# Altium project Remote_Sensor_Unit-v1.0.PrjPcb (part 3 of 4)

## Sheet Power_Sheet2.SchDoc
size A4; SheetNumber: 4; SheetTotal: 7
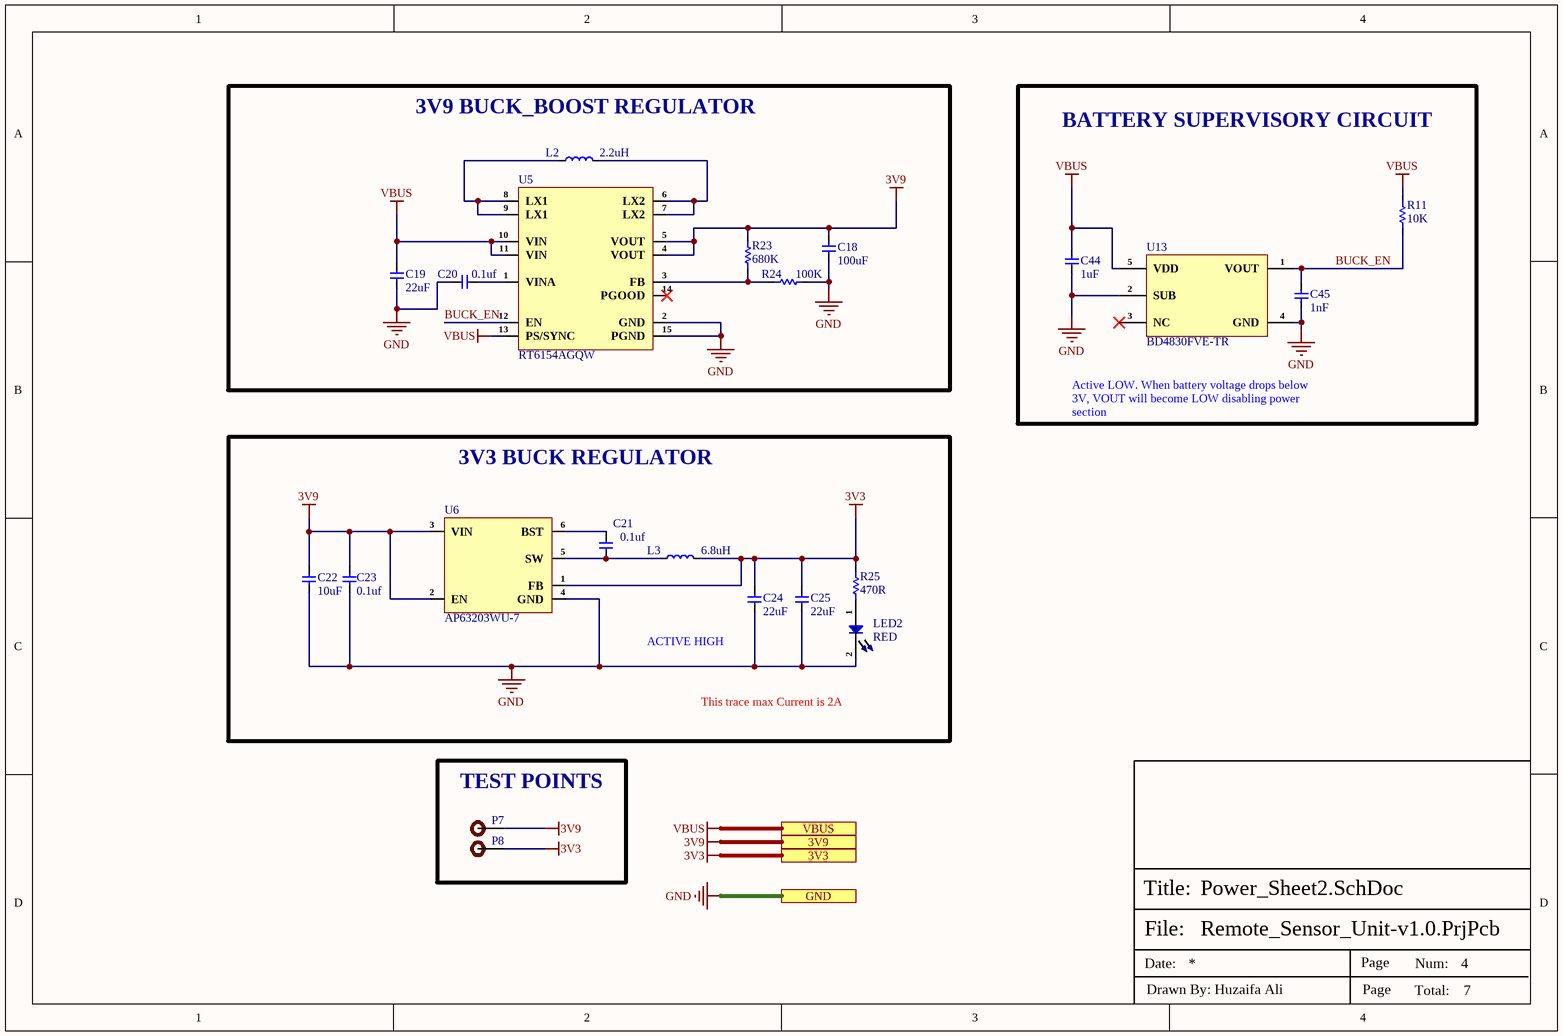
[diagram p3: Power_Sheet2.SchDoc]

### Parts
C18  100uF  [Cap-1210]
C19  22uF  [Cap-0805]
C20  0.1uf  [Cap-0402]
C21  0.1uf  [Cap-0402]
C22  10uF  [Cap-0402]
C23  0.1uf  [Cap-0402]
C24  22uF  [Cap-0805]
C25  22uF  [Cap-0805]
C44  1uF  [Cap-0402]
C45  1nF  [CAP-0201]
L2  2.2uH  [NRS5024T2R2NMGJ]
L3  6.8uH  [LVC505040-6R8M-N_]
LED2  RED  [LED-0603]
P7  TEST POINT  [Test-point]  (value not drawn)
P8  TEST POINT  [Test-point]  (value not drawn)
R11  10K  [Res-0201]
R23  680K  [Res-0603]
R24  100K  [Res-0603]
R25  470R  [Res-0201]
U5  RT6154AGQW  [DFN-14(3x4)]
U6  AP63203WU-7  [TSOT-23-6]
U13  BD4830FVE-TR  [VSOF-5]

### Blocks framed on the sheet
3V9 BUCK_BOOST REGULATOR: C18-C20 L2 R23 R24 U5
BATTERY SUPERVISORY CIRCUIT: C44 C45 R11 U13
3V3 BUCK REGULATOR: C21-C25 L3 LED2 R25 U6
TEST POINTS: P7 P8

### Ports
3V3, 3V9, GND, VBUS

### Nets
3V3: C24.2 C25.2 L3.2 P8.1 R25.2 U6.1(FB) ; port 3V3
3V9: C18.2 C22.2 C23.2 P7.1 R23.2 U5.4(VOUT) U5.5(VOUT) U6.2(EN) U6.3(VIN) ; port 3V9
GND: C18.1 C19.1 C20.2 C22.1 C23.1 C24.1 C25.1 C44.2 C45.1 LED2.2 R24.1 U5.2(GND) U5.15(PGND) U6.4(GND) U13.2(SUB) U13.4(GND) ; port GND
VBUS: C19.2 C44.1 R11.2 U5.10(VIN) U5.11(VIN) U5.13(PS/SYNC) U13.5(VDD) ; port VBUS
BUCK_EN: C45.2 R11.1 U5.12(EN) U13.1(VOUT)
NetC20_1: C20.1 U5.1(VINA)
NetC21_1: C21.1 L3.1 U6.5(SW)
NetC21_2: C21.2 U6.6(BST)
NetL2_1: L2.1 U5.8(LX1) U5.9(LX1)
NetL2_2: L2.2 U5.6(LX2) U5.7(LX2)
NetLED2_1: LED2.1 R25.1
NetR23_1: R23.1 R24.2 U5.3(FB)

Not connected (* = marked no-connect by the designer): U5 14(PGOOD)*; U13 3(NC)*

### Notes on the sheet
- Active LOW. When battery voltage drops below 3V, VOUT will become LOW disabling power section
- (near C24) ACTIVE HIGH
- (near LED2) This trace max Current is 2A
- File:
- Title:
- Date:
- Page
- Num:
- Total:
- Drawn By: Huzaifa Ali

### Library data of the parts
C18 = EMK325ABJ107MM-P: CAP CER 100UF 16V X5R 1210; Manufacturer: Taiyo Yuden; Tolerance: 20%; Item Type: Capacitor; Supplier 1: Digi-Key; Manufacturer Part Number: EMK325ABJ107MM-P; RoHS: Yes; Category: Ceramic Capacitors; Stock 1: 81344; Pricing 1: 1=1.75, 10=1.415, 50=1.2352, 100=1.0809, 500=0.82352 (USD); Mounting Technology: Surface Mount; Case/Package: 1210; Case Code (Imperial): 1210; Case Code (Metric): 3225; Min Operating Temperature: -55°C; Max Operating Temperature: 85°C; Packaging: Cut Tape; Value: 100uF; Voltage Rating: 16V; Series: M; Lead Free: Lead Free; RoHS Compliant: Yes; ComponentLink1URL: http://ds.yuden.co.jp/TYCOMPAS/ut/detail.do?productNo=EMK325ABJ107MM-P&fileName=EMK325ABJ107MM-P_SS&mode=specSheetDownload&src-supplier=Digi-Key; ComponentLink1Description: http://ds.yuden.co.jp/TYCOMPAS/ut/detail.do?productNo=EMK325ABJ107MM-P&fileName=EMK325ABJ107MM-P_SS&mode=specSheetDownload&src-supplier=Digi-Key; Supplier Part Number 1: 587-5426-1-ND; LCSC Part Number: C90143
C19 C24 C25 = CC0805MKX5R8BB226: CAP CER 22UF 25V X5R 0805; Manufacturer: Yageo; Tolerance: 20%; Item Type: Capacitor; Supplier 1: Digi-Key; Manufacturer Part Number: CC0805MKX5R8BB226; RoHS: Yes; Category: Ceramic Capacitors; Stock 1: 64970; Pricing 1: 1=0.47000, 10=0.33300, 50=0.25140, 100=0.21900, 500=0.16222, 1000=0.13789 (USD); Mount: Surface Mount; Case/Package: 0805; Case Code (Metric): 2012; Case Code (Imperial): 0805; Weight: 0.000194oz; Min Operating Temperature: -55°C; Max Operating Temperature: 85°C; Packaging: Tape and Reel; Capacitance: 22uF; Voltage Rating: 25V; Dielectric: X5R; Termination: SMD/SMT; Voltage Rating (DC): 25V; Package Quantity: 3000; Length: 0.079inch; Width: 0.049inch; Height: 1.25mm; Thickness: 0.057inch; Lead Free: Lead Free; Halogen Free: Halogen Free; RoHS Compliant: Yes; ComponentLink1URL: http://www.mouser.com/ds/2/447/Yageo_UPY-GP_NP0_16V-to-50V_9-358835.pdf?src-supplier=Mouser; ComponentLink1Description: http://www.mouser.com/ds/2/447/Yageo_UPY-GP_NP0_16V-to-50V_9-358835.pdf?src-supplier=Mouser; ComponentLink2URL: http://www.yageo.com/documents/recent/UPY-GPHC_X5R_4V-to-50V_25.pdf?src-supplier=Digi-Key; ComponentLink2Description: http://www.yageo.com/documents/recent/UPY-GPHC_X5R_4V-to-50V_25.pdf?src-supplier=Digi-Key; Supplier Part Number 1: 311-1903-1-ND; LCSC Part Number: C784585
C20 C21 C23 = GRM155R62A104KE14D: CAP CER 0.1UF 100V X5R 0402; Manufacturer: Murata; Capacitance: 100nF; Tolerance: 10%; Item Type: Capacitor; Supplier 1: Arrow Electronics; Manufacturer Part Number: GRM155R62A104KE14D; RoHS: Yes; Category: Ceramic Capacitors; Stock 1: 870000; Pricing 1: 10000=0.00500, 20000=0.00410, 30000=0.00390, 50000=0.00370, 100000=0.00300 (USD); Mount: Surface Mount; Case/Package: 0402; Case Code (Metric): 1005; Case Code (Imperial): 0402; Weight: 0.000212oz; Min Operating Temperature: -55°C; Max Operating Temperature: 85°C; Packaging: Tape and Reel; Voltage Rating: 100V; Dielectric: X5R; Termination: SMD/SMT; Voltage Rating (DC): 100V; Package Quantity: 10000; Series: GRM; Length: 0.039inch; Width: 0.02inch; Height: 0.5mm; Thickness: 0.022inch; Reach SVHC Compliant: Yes; Lead Free: Lead Free; RoHS Compliant: Yes; ComponentLink1URL: http://www.farnell.com/datasheets/2079151.pdf?src-supplier=Farnell; ComponentLink1Description: http://www.farnell.com/datasheets/2079151.pdf?src-supplier=Farnell; ComponentLink2URL: http://www.mouser.com/ds/2/281/c02e-2905.pdf?src-supplier=Mouser; ComponentLink2Description: http://www.mouser.com/ds/2/281/c02e-2905.pdf?src-supplier=Mouser; ComponentLink3URL: http://www.farnell.com/datasheets/2079151.pdf?src-supplier=Element14; ComponentLink3Description: http://www.farnell.com/datasheets/2079151.pdf?src-supplier=Element14; ComponentLink4URL: http://search.murata.co.jp/Ceramy/image/img/A01X/G101/ENG/GRM155R62A104KE14-01.pdf?src-supplier=Digi-Key; ComponentLink4Description: http://search.murata.co.jp/Ceramy/image/img/A01X/G101/ENG/GRM155R62A104KE14-01.pdf?src-supplier=Digi-Key; ComponentLink5URL: http://www.farnell.com/datasheets/2079151.pdf?src-supplier=Newark; ComponentLink5Description: http://www.farnell.com/datasheets/2079151.pdf?src-supplier=Newark; Supplier Part Number 1: GRM155R62A104KE14D; LCSC Part Number: C162178
C22 = CL05A106MP5NUNC: CAP CER 10UF 10V X5R 0402; Manufacturer: Samsung; Tolerance: 20%; Item Type: Capacitor; Supplier 1: Avnet; Manufacturer Part Number: CL05A106MP5NUNC; RoHS: Yes; Category: Ceramic Capacitors; Stock 1: 1729850; Pricing 1: 10000=0.02537 (USD); Mount: Surface Mount; Case/Package: 0402; Case Code (Metric): 1005; Case Code (Imperial): 0402; Contact Plating: Tin; Min Operating Temperature: -55°C; Max Operating Temperature: 85°C; Package Quantity: 1; Packaging: Tape and Reel; Capacitance: 10uF; Voltage Rating: 10V; Dielectric: X5R; Termination: Wraparound; Series: CL; Construction: Flat; Length: 1mm; Width: 0.02inch; Thickness: 0.028inch; Depth: 0.5mm; Radiation Hardening: No; Lead Free: Lead Free; RoHS Compliant: Yes; ComponentLink1URL: https://datasheet.ciiva.com/25721/cl05a106mp5nunc-25721584.pdf?src-supplier=Digi-Key; ComponentLink1Description: https://datasheet.ciiva.com/25721/cl05a106mp5nunc-25721584.pdf?src-supplier=Digi-Key; ComponentLink2URL: https://datasheet.ciiva.com/26838/getdatasheetpartid-745310-26838170.pdf?src-supplier=Verical; ComponentLink2Description: https://datasheet.ciiva.com/26838/getdatasheetpartid-745310-26838170.pdf?src-supplier=Verical; Supplier Part Number 1: CL05A106MP5NUNC; LCSC Part Number: C315248
C44 = UMK105CBJ105MV-F: CAP CER 1UF 50V X5R 0402; Manufacturer: Taiyo Yuden; Item Type: Capacitor; Supplier 1: Digi-Key; Manufacturer Part Number: UMK105CBJ105MV-F; Stock 1: 412061; Pricing 1: 1=0.27, 10=0.184, 50=0.1224, 100=0.104, 500=0.07342, 1000=0.06424, 2500=0.06118, 5000=0.05659 (USD); Lead Free: Lead Free; RoHS Compliant: Yes; ComponentLink1URL: http://www.farnell.com/datasheets/2801300.pdf?src-supplier=Newark; ComponentLink1Description: http://www.farnell.com/datasheets/2801300.pdf?src-supplier=Newark; ComponentLink2URL: http://www.farnell.com/datasheets/2801300.pdf?src-supplier=Farnell; ComponentLink2Description: http://www.farnell.com/datasheets/2801300.pdf?src-supplier=Farnell; ComponentLink3URL: https://ds.yuden.co.jp/TYCOMPAS/ut/detail?pn=UMK105CBJ105MV-F &amp;u=M&src-supplier=Digi-Key; ComponentLink3Description: https://ds.yuden.co.jp/TYCOMPAS/ut/detail?pn=UMK105CBJ105MV-F &amp;u=M&src-supplier=Digi-Key; Supplier Part Number 1: 587-6278-1-ND; LCSC Part Number: C2880413
C45 = CC0201KRX5R8BB102: CAP CER 1000PF 25V X5R 0201; Manufacturer: Yageo; Tolerance: 10%; Supplier 1: Mouser; Manufacturer Part Number: CC0201KRX5R8BB102; RoHS: Yes; Category: Ceramic Capacitors; Stock 1: 54104; Pricing 1: 1=0.10000, 10=0.02600, 50=0.02600, 100=0.01100, 1000=0.00700, 10000=0.00500 (USD); Mount: Surface Mount; Case/Package: 0201; Min Operating Temperature: -55°C; Max Operating Temperature: 85°C; Packaging: Tape and Reel; Capacitance: 1nF; Voltage Rating: 25V; Voltage Rating (DC): 25V; Dielectric: X5R; Length: 0.024inch; Width: 0.012inch; Thickness: 0.013inch; Lead Free: Lead Free; Halogen Free: Halogen Free; RoHS Compliant: Yes; ComponentLink1URL: http://www.yageo.com/documents/recent/UPY-GPHC_X5R_4V-to-50V_25.pdf?src-supplier=Digi-Key; ComponentLink1Description: http://www.yageo.com/documents/recent/UPY-GPHC_X5R_4V-to-50V_25.pdf?src-supplier=Digi-Key; ComponentLink2URL: https://www.yageo.com/upload/media/product/productsearch/datasheet/mlcc/UPY-GPHC_X5R_4V-to-50V_25.pdf?src-supplier=Digi-Key; ComponentLink2Description: https://www.yageo.com/upload/media/product/productsearch/datasheet/mlcc/UPY-GPHC_X5R_4V-to-50V_25.pdf?src-supplier=Digi-Key; ComponentLink3URL: http://www.yageo.com/exep/pages/download/literatures/ProductSelectionGuide%202014_Final_2.pdf?src-supplier=Digi-Key; ComponentLink3Description: http://www.yageo.com/exep/pages/download/literatures/ProductSelectionGuide%202014_Final_2.pdf?src-supplier=Digi-Key; Supplier Part Number 1: 603-CC0201KR8BB102; LCSC Part Number: C541213
L2 = NRS5024T2R2NMGJ: FIXED IND 2.2UH 3.1A 29 MOHM SMD; Manufacturer: Taiyo Yuden; Core Material: Ferrite; Saturation Current: 4.1A; Shielding: Shielded; DC Resistance (DCR): 29mR; Self Resonant Frequency: 51MHz; Test Frequency: 100kHz; Tolerance: 30%; Item Type: Inductor; Supplier: Digi-Key; Supplier Part Number: 587-6102-1-ND; Manufacturer Part Number: NRS5024T2R2NMGJ; RoHS: Yes; Category: Fixed Inductors; Stock: 19904; Pricing: 1=0.28, 10=0.247, 25=0.212, 50=0.1944, 100=0.1768, 250=0.16616, 500=0.14848, 1000=0.12019 (USD); Mounting Technology: Surface Mount; Case/Package: Nonstandard; Min Operating Temperature: -25°C; Max Operating Temperature: 120°C; Packaging: Tape and Reel; Resistor Type: Wirewound; Value: 2.2uH; Current Rating: 3.1A; Length: 0.193inch; Width: 0.193inch; Height - Seated (Max): 0.094inch; RoHS Compliant: Yes; ComponentLink1URL: https://datasheet.octopart.com/NRS5024T2R2NMGJ-Taiyo-Yuden-datasheet-99833426.pdf?src-supplier=Future+Electronics; ComponentLink1Description: https://datasheet.octopart.com/NRS5024T2R2NMGJ-Taiyo-Yuden-datasheet-99833426.pdf?src-supplier=Future+Electronics; ComponentLink2URL: http://ds.yuden.co.jp/TYCOMPAS/ut/detail.do?productNo=NRS5024T2R2NMGJ&fileName=NRS5024T2R2NMGJ_SS&mode=specSheetDownload&src-supplier=Digi-Key; ComponentLink2Description: http://ds.yuden.co.jp/TYCOMPAS/ut/detail.do?productNo=NRS5024T2R2NMGJ&fileName=NRS5024T2R2NMGJ_SS&mode=specSheetDownload&src-supplier=Digi-Key; ComponentLink3URL: https://ds.yuden.co.jp/TYCOMPAS/ut/detail?pn=NRS5024T2R2NMGJ  &amp;u=M&src-supplier=Digi-Key; ComponentLink3Description: https://ds.yuden.co.jp/TYCOMPAS/ut/detail?pn=NRS5024T2R2NMGJ  &amp;u=M&src-supplier=Digi-Key; LCSC Part Number: C222926
L3 = LVC505040-6R8M-N: 2.7A 6.8uH ±20% 50mΩ SMD Power Inductors ROHS; Manufacturer: Chlisin Elec; ComponentLink1Description: LCSC; ComponentLink1URL: https://www.lcsc.com/product-detail/Power-Inductors_Chilisin-Elec-LVC505040-6R8M-N_C285870.html; Manufacturer Part Number: LVC505040-6R8M-N; Value: 6.8uH; Footprint: Custom; LCSC Part Number: C285870; Item Type: Inductor
LED2 = 19-21/R7C-AK1L2BY/3T: Red 632nm LED Indication - Discrete 2.05V 0603 (1608 Metric); Manufacturer: Everlight Elec; Manufacturer Part Number: 19-21/R7C-AK1L2BY/3T; Package: 0603; LCSC Part Number: C1322287; Item Type: LED; ComponentLink1Description: LCSC; ComponentLink1URL: https://www.lcsc.com/product-detail/Light-Emitting-Diodes-LED_Everlight-Elec-19-21-R7C-AK1L2BY-3T_C1322287.html
P7 P8 = TEST POINT: Test Point ON
R11 = RC0201FR-0710KL: RES SMD 10K OHM 1% 1/20W 0201; Manufacturer: Yageo; Item Type: Resistor; Manufacturer Part Number: RC0201FR-0710KL; Package: 0201; ComponentLink7Description: LCSC; ComponentLink7URL: https://www.lcsc.com/product-detail/Chip-Resistor-Surface-Mount_YAGEO-RC0201FR-0710KL_C106225.html; LCSC Part Number: C106225
R23 = RT0603BRE07680KL: Res Thin Film 0603 680K Ohm 0.1% 1/10W ±50ppm/°C Molded SMD SMD Paper T/R; Manufacturer: Yageo; Value: 680kR; Max Power Dissipation: 100mW; Item Type: Resistor; Supplier: Digi-Key; Supplier Part Number: RT0603BRE07680KL-ND; Manufacturer Part Number: RT0603BRE07680KL; RoHS: Yes; Category: Chip SMD Resistors; Pricing: 5000=0.04588 (USD); Case/Package: 0603; Contact Plating: Tin,Matte; Min Operating Temperature: -55°C; Max Operating Temperature: 155°C; Tolerance: 0.1%; Packaging: Tape and Reel; Number of Terminations: 2; Temperature Coefficient: 50ppm/°C; Series: RT; RoHS Compliant: Yes; ComponentLink1URL: http://www.yageo.com/documents/recent/PYu-RT_1-to-0.05_RoHS_L_6.pdf?src-supplier=Avnet; ComponentLink1Description: http://www.yageo.com/documents/recent/PYu-RT_1-to-0.05_RoHS_L_6.pdf?src-supplier=Avnet; ComponentLink2URL: http://www.yageo.com/documents/recent/PYu-RT_1-to-0.01_RoHS_L_8.pdf?src-supplier=Digi-Key; ComponentLink2Description: http://www.yageo.com/documents/recent/PYu-RT_1-to-0.01_RoHS_L_8.pdf?src-supplier=Digi-Key; LCSC Part Number: C862257; ComponentLink3Description: LCSC; ComponentLink3URL: https://www.lcsc.com/product-detail/Chip-Resistor-Surface-Mount_YAGEO-RT0603BRE07680KL_C862257.html
R24 = RT0603BRD07100KL: RES SMD 100K OHM 0.1% 1/10W 0603; Manufacturer: Yageo; Resistance: 100kR; Temperature Coefficient: 25ppm/°C; Voltage Rating (DC): 75V; Power Rating: 100mW; Item Type: Resistor; Supplier 1: Digi-Key; Manufacturer Part Number: RT0603BRD07100KL; Stock 1: 53395; Pricing 1: 1=0.39, 10=0.332, 100=0.1298, 1000=0.05435, 2500=0.04982 (USD); Mount: Surface Mount; Case/Package: 0603; Case Code (Imperial): 0603; Case Code (Metric): 1608; Min Operating Temperature: -55°C; Max Operating Temperature: 125°C; Tolerance: 0.1%; Composition: Thin Film; Packaging: Tape and Reel; Voltage Rating: 75V; Package Quantity: 5000; Termination: SMD/SMT; Number of Terminations: 2; Military Standard: Not; Max Power Dissipation: 100mW; Working Voltage: 75V; Features: Moisture Resistant; Length: 1.6mm; Height: 0.022inch; Width: 0.031inch; Depth: 0.8mm; Lead Free: Lead Free; ComponentLink1URL: http://documents.rs-components.com/techlib://itc_doclist_GB.htm?stockno=6174810&src-supplier=RSComponents; ComponentLink1Description: http://documents.rs-components.com/techlib://itc_doclist_GB.htm?stockno=6174810&src-supplier=RSComponents; Supplier Part Number 1: YAG1235CT-ND; LCSC Part Number: C122538
R25 = RC0201JR-07470RL: RES 470 OHM 5% 1/20W 0201; Manufacturer: Yageo; Temperature Coefficient: 200ppm/°C; Voltage Rating (DC): 25V; Max Power Dissipation: 50mW; Supplier 1: Digi-Key; Manufacturer Part Number: RC0201JR-07470RL; RoHS: Yes; Category: Chip SMD Resistors; Stock 1: 173754; Pricing 1: 1=0.10000, 10=0.02600, 100=0.01040, 1000=0.00466, 2500=0.00405, 5000=0.00334 (USD); Case/Package: 0201; Number of Pins: 2; Contact Plating: Tin,Matte; Case Code (Metric): 0603; Case Code (Imperial): 0201; Min Operating Temperature: -55°C; Max Operating Temperature: 125°C; Resistor Type: Thick Film; Tolerance: 5%; Resistance: 470R; Number of Terminations: 2; Termination: SMD/SMT; Features: Moisture Resistant; Power Rating: 50mW; Voltage Rating: 25V; Package Quantity: 1; Packaging: Tape and Reel; Length: 0.6mm; Width: 0.3mm; Height: 0.01inch; Depth: 0.3mm; Radiation Hardening: No; Military Standard: Not; Lead Free: Lead Free; REACH SVHC: No SVHC; ComponentLink1URL: https://datasheet.ciiva.com/5924/443682-5924928.pdf?src-supplier=Farnell; ComponentLink1Description: https://datasheet.ciiva.com/5924/443682-5924928.pdf?src-supplier=Farnell; ComponentLink2URL: https://datasheet.ciiva.com/8885/pyu-rc0201-51-rohs-l-8-8885600.pdf?src-supplier=Avnet; ComponentLink2Description: https://datasheet.ciiva.com/8885/pyu-rc0201-51-rohs-l-8-8885600.pdf?src-supplier=Avnet; ComponentLink3URL: https://datasheet.ciiva.com/28390/pyu-rc0201-51-rohs-l-8-28390376.pdf?src-supplier=Avnet+Europe; ComponentLink3Description: https://datasheet.ciiva.com/28390/pyu-rc0201-51-rohs-l-8-28390376.pdf?src-supplier=Avnet+Europe; ComponentLink4URL: https://datasheet.ciiva.com/8885/pyu-rc0201-51-rohs-l-8-8885642.pdf?src-supplier=Avnet; ComponentLink4Description: https://datasheet.ciiva.com/8885/pyu-rc0201-51-rohs-l-8-8885642.pdf?src-supplier=Avnet; ComponentLink5URL: https://datasheet.ciiva.com/2462/pyu-r-int-thick-7-2462802.pdf?src-supplier=Digi-Key; ComponentLink5Description: https://datasheet.ciiva.com/2462/pyu-r-int-thick-7-2462802.pdf?src-supplier=Digi-Key; ComponentLink6URL: https://datasheet.ciiva.com/2462/pyu-r-int-thick-7-2462803.pdf?src-supplier=Digi-Key; ComponentLink6Description: https://datasheet.ciiva.com/2462/pyu-r-int-thick-7-2462803.pdf?src-supplier=Digi-Key; ComponentLink7URL: https://datasheet.ciiva.com/2462/pyu-r-int-thick-7-2462804.pdf?src-supplier=Digi-Key; ComponentLink7Description: https://datasheet.ciiva.com/2462/pyu-r-int-thick-7-2462804.pdf?src-supplier=Digi-Key; Supplier Part Number 1: 311-470NCT-ND; LCSC Part Number: C163491
U5 = RT6154AGQW: IC REG BCK BST ADJ 4A 14WDFN; Manufacturer: Richtek; Supplier: Digi-Key; Supplier Part Number: 1028-1338-1-ND; Manufacturer Part Number: RT6154AGQW; RoHS: Yes; Category: Voltage Regulators - Switching; Stock: 7681; Pricing: 1=2.97, 10=2.668, 25=2.5176, 100=2.1448, 250=2.01392, 500=1.7622 (USD); ComponentLink1URL: http://www.farnell.com/datasheets/2045512.pdf?src-supplier=Element14; ComponentLink1Description: http://www.farnell.com/datasheets/2045512.pdf?src-supplier=Element14; ComponentLink2URL: https://www.richtek.com/assets/product_file/RT6154A=RT6154B/DS6154AB-01.pdf?src-supplier=Digi-Key; ComponentLink2Description: https://www.richtek.com/assets/product_file/RT6154A=RT6154B/DS6154AB-01.pdf?src-supplier=Digi-Key; LCSC Part Number: C250400; Item Type: IC
U6 = AP63203WU-7: IC REG BUCK 3.3V 2A TSOT26; Manufacturer: Diodes; Supplier: Future Electronics; Supplier Part Number: 6109504; Manufacturer Part Number: AP63203WU-7; RoHS: Yes; Category: Voltage Regulators - Switching; Stock: 3000; Pricing: 3000=0.34, 6000=0.335, 9000=0.33, 12000=0.33, 15000=0.32 (USD); ComponentLink1URL: https://www.diodes.com/assets/Datasheets/AP63200-AP63201-AP63203-AP63205.pdf?src-supplier=Digi-Key; ComponentLink1Description: https://www.diodes.com/assets/Datasheets/AP63200-AP63201-AP63203-AP63205.pdf?src-supplier=Digi-Key; LCSC Part Number: C780769; Item Type: IC
U13 = BD4830FVE-TR: Active Low 1 VSOF-5 Monitors & Reset Circuits ROHS; Manufacturer: Rohm; Max Supply Voltage: 10V; Max Power Dissipation: 210mW; Min Supply Voltage: 1.2V; Number of Voltages Monitored: 1; Threshold Voltage: 6V; Accuracy: 1%; Operating Supply Current: 900nA; Max Supply Current: 1.98uA; Watchdog Timer: No; Min Reset Threshold Voltage: 5.91V; Max Reset Threshold Voltage: 6.09V; Item Type: IC; Manufacturer Part Number: BD4830FVE-TR; RoHS: Yes; Category: Voltage Supervisors; Stock 1: 5990; Pricing 1: 1=0.64000, 10=0.54900, 25=0.51200, 100=0.40960, 250=0.38032, 500=0.32182, 1000=0.24868 (USD); Mounting Technology: Surface Mount; Case/Package: VSOF; Pins: 5; Min Operating Temperature: -40°C; Max Operating Temperature: 105°C; Package Quantity: 3000; Packaging: Tape and Reel; Reset: Active Low; Number of Monitored Inputs: 1; Type: Simple Reset/Power-On Reset,Voltage Detector; Series: BD48xxx; Lead Free: Lead Free; RoHS Compliant: Yes; ComponentLink1URL: https://datasheet.ciiva.com/1974/bd48xxg-e-1974994.pdf?src-supplier=Digi-Key; ComponentLink1Description: https://datasheet.ciiva.com/1974/bd48xxg-e-1974994.pdf?src-supplier=Digi-Key; ComponentLink2URL: https://datasheet.ciiva.com/8133/bd48xxg-e-8133113.pdf?src-supplier=Avnet; ComponentLink2Description: https://datasheet.ciiva.com/8133/bd48xxg-e-8133113.pdf?src-supplier=Avnet; LCSC Part Number: C2067200; Supplier 1: Rs; Supplier Part Number 1: 1717448; ComponentLink3Description: LCSC; ComponentLink3URL: https://www.lcsc.com/product-detail/Monitors-Reset-Circuits_ROHM-Semicon-BD4830FVE-TR_C2067200.html

## Sheet mPCIe_Connector_Sheet.SchDoc
size A4; SheetNumber: 7; SheetTotal: 7
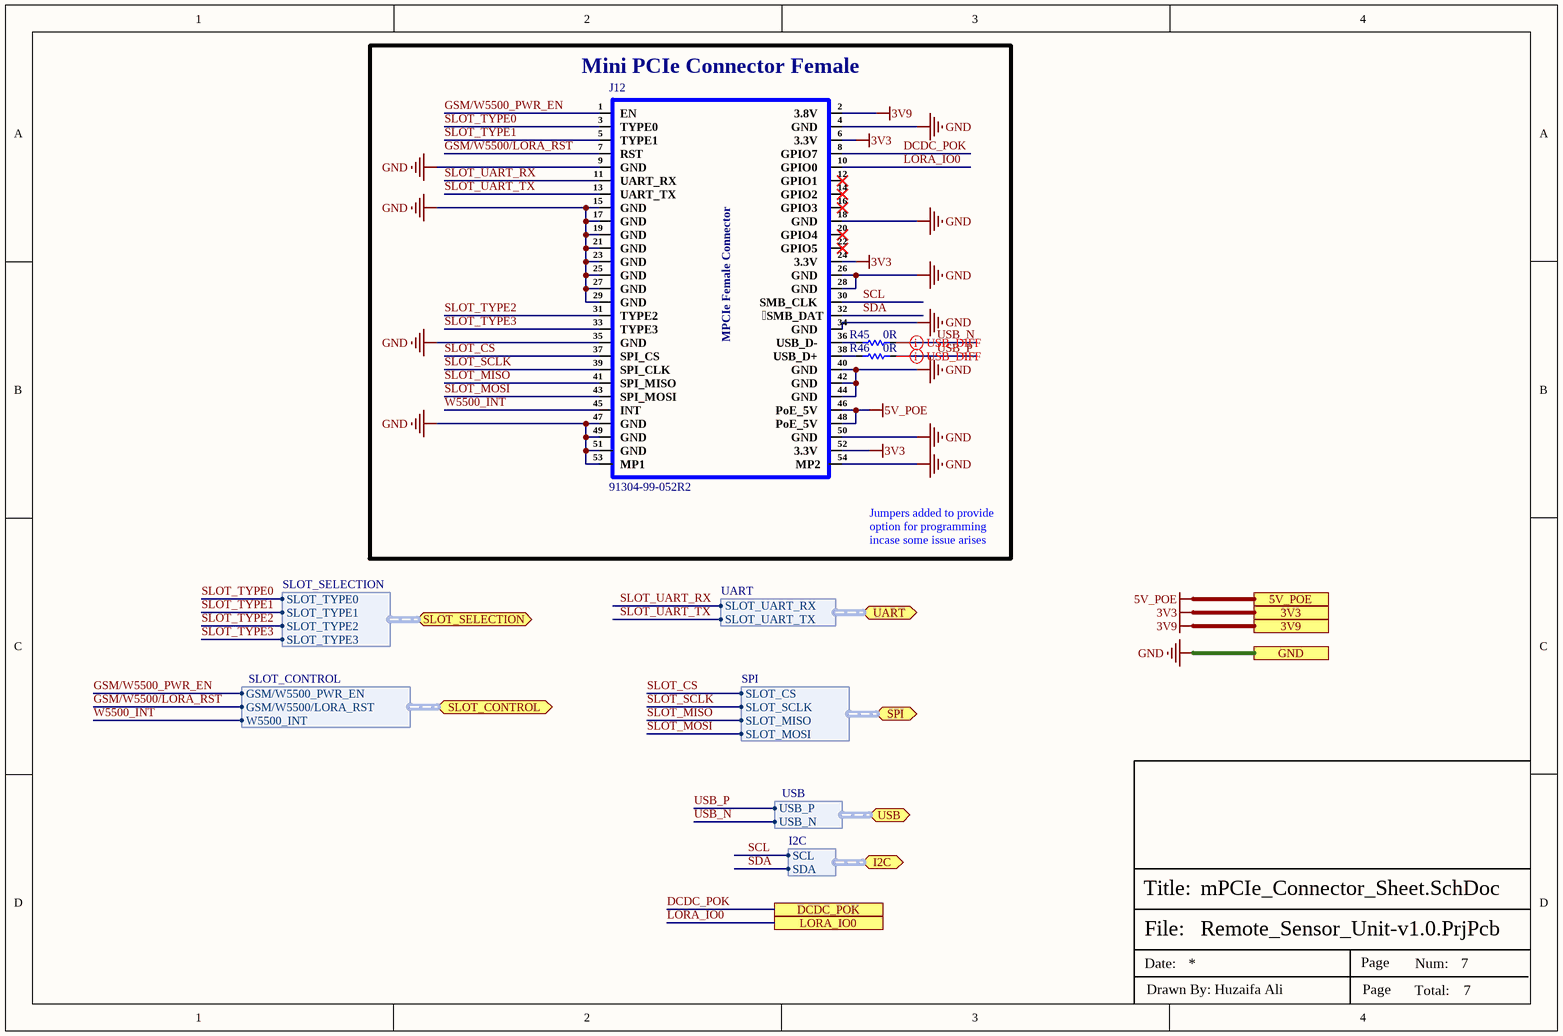
[diagram p4: mPCIe_Connector_Sheet.SchDoc]

### Parts
J12  91304-99-052R2  [91304-99-052R2]
R45  0R  [Res-0402]
R46  0R  [Res-0402]

### Blocks framed on the sheet
Mini PCIe Connector Female: J12 R45 R46

### Ports
3V3, 3V9, 5V_POE, DCDC_POK, GND, I2C (bidir, harness I2C), LORA_IO0, SLOT_CONTROL (bidir, harness SLOT_CONTROL), SLOT_SELECTION (bidir, harness SLOT_SELECTION), SPI (bidir, harness SPI), UART (bidir, harness UART), USB (bidir, harness USB)

### Harnesses
USB: USB_P, USB_N
SLOT_SELECTION: SLOT_TYPE0, SLOT_TYPE1, SLOT_TYPE2, SLOT_TYPE3
SLOT_CONTROL: GSM/W5500_PWR_EN, GSM/W5500/LORA_RST, W5500_INT
UART: SLOT_UART_RX, SLOT_UART_TX
SPI: SLOT_CS, SLOT_SCLK, SLOT_MISO, SLOT_MOSI
I2C: SCL, SDA

### Nets
3V3: J12.6(3.3V) J12.24(3.3V) J12.52(3.3V) ; port 3V3
3V9: J12.2(3.8V) ; port 3V9
5V_POE: J12.46(PoE_5V) J12.48(PoE_5V) ; port 5V_POE
GND: J12.4(GND) J12.9(GND) J12.15(GND) J12.17(GND) J12.18(GND) J12.19(GND) J12.21(GND) J12.23(GND) J12.25(GND) J12.26(GND) J12.27(GND) J12.28(GND) J12.29(GND) J12.34(GND) J12.35(GND) J12.40(GND) J12.42(GND) J12.44(GND) J12.47(GND) J12.49(GND) J12.50(GND) J12.51(GND) J12.53(MP1) J12.54(MP2) ; port GND
DCDC_POK: J12.8(GPIO7) ; port DCDC_POK
GSM/W5500/LORA_RST: J12.7(RST) ; port SLOT_CONTROL.GSM/W5500/LORA_RST
GSM/W5500_PWR_EN: J12.1(EN) ; port SLOT_CONTROL.GSM/W5500_PWR_EN
LORA_IO0: J12.10(GPIO0) ; port LORA_IO0
SCL: J12.30(SMB_CLK) ; port I2C.SCL  [project net I2C.SCL]
SDA: J12.32(SMB_DAT) ; port I2C.SDA  [project net I2C.SDA]
SLOT_CS: J12.37(SPI_CS) ; port SPI.SLOT_CS
SLOT_MISO: J12.41(SPI_MISO) ; port SPI.SLOT_MISO
SLOT_MOSI: J12.43(SPI_MOSI) ; port SPI.SLOT_MOSI
SLOT_SCLK: J12.39(SPI_CLK) ; port SPI.SLOT_SCLK
SLOT_TYPE0: J12.3(TYPE0) ; port SLOT_SELECTION.SLOT_TYPE0
SLOT_TYPE1: J12.5(TYPE1) ; port SLOT_SELECTION.SLOT_TYPE1
SLOT_TYPE2: J12.31(TYPE2) ; port SLOT_SELECTION.SLOT_TYPE2
SLOT_TYPE3: J12.33(TYPE3) ; port SLOT_SELECTION.SLOT_TYPE3
SLOT_UART_RX: J12.11(UART_RX) ; port UART.SLOT_UART_RX
SLOT_UART_TX: J12.13(UART_TX) ; port UART.SLOT_UART_TX
USB_N: R45.2 ; port USB.USB_N  [project net USB.USB_N]
USB_P: R46.2 ; port USB.USB_P  [project net USB.USB_P]
W5500_INT: J12.45(INT) ; port SLOT_CONTROL.W5500_INT
NetJ12_36: J12.36(USB_D-) R45.1
NetJ12_38: J12.38(USB_D+) R46.1

Not connected (* = marked no-connect by the designer): J12 12(GPIO1)* 14(GPIO2)* 16(GPIO3)* 20(GPIO4)* 22(GPIO5)*

### Layout directives
differential pair; net class USB_DIFF; differential pair class USB_DIFF_Lines; rule Matched Net Lengths [Tolerance = 20mil]; rule Impedance Constraint [Min = 85.00    Max = 95.00    ]: USB.USB_N, USB.USB_P

### Notes on the sheet
- Jumpers added to provide option for programming incase some issue arises
- File:
- Title:
- Date:
- Page
- Num:
- Total:
- Drawn By: Huzaifa Ali
- (in symbol 91304-99-052R2) MPCIe Female Connector

### Library data of the parts
J12 = 91304-99-052R2: 0.8mm mPCI-E Surface Mount 52 SMD,P=0.8mm Card Edge Connectors ROHS; Manufacturer: UMAX; Item Type: mPCI-E Connector; Manufacturer Part Number: 91304-99-052R2; ComponentLink1Description: LCSC; ComponentLink1URL: https://www.lcsc.com/product-detail/Card-Edge-Connectors_UMAX-91304-99-052R2_C404126.html; Package: SMD,P=0.8mm; LCSC Part Number: C404126
R45 R46 = RC0402FR-070RL: RES 0 OHM JUMPER 1/16W 0402; Manufacturer: Yageo; Tolerance: 1%; Power Rating: 62.5mW; Voltage Rating: 50V; Temperature Coefficient: 200ppm/°C; Max Power Dissipation: 63mW; Supplier 1: Mouser; Manufacturer Part Number: RC0402FR-070RL; RoHS: Yes; Category: Chip SMD Resistors; Stock 1: 8556842; Pricing 1: 1=0.10000, 10=0.01400, 50=0.01400, 100=0.00600, 1000=0.00300, 5000=0.00200, 10000=0.00100 (USD); Mount: Surface Mount; Case/Package: 0402; Contact Plating: Tin,Matte; Case Code (Imperial): 0402; Case Code (Metric): 1005; Size Code: 0402; Min Operating Temperature: -55°C; Max Operating Temperature: 155°C; Resistance: 0R; Resistor Type: Thick Film; Packaging: Tape and Reel; Termination: SMD/SMT; Features: Moisture Resistant; Series: RC; Number of Terminations: 2; Length: 1mm; Width: 0.5mm; Height: 0.35mm; Radiation Hardening: No; Lead Free: Lead Free; RoHS Compliant: Yes; ComponentLink1URL: https://datasheet.ciiva.com/8896/pyu-rc0402-51-rohs-l-6-8896149.pdf?src-supplier=Avnet; ComponentLink1Description: https://datasheet.ciiva.com/8896/pyu-rc0402-51-rohs-l-6-8896149.pdf?src-supplier=Avnet; ComponentLink2URL: https://datasheet.ciiva.com/16790/pyu-rc0402-51-rohs-l-6-r-16790444.pdf?src-supplier=Future+Electronics; ComponentLink2Description: https://datasheet.ciiva.com/16790/pyu-rc0402-51-rohs-l-6-r-16790444.pdf?src-supplier=Future+Electronics; Supplier Part Number 1: 603-RC0402FR-070RL; LCSC Part Number: C106231

## Sheet Relay_Buzzer_Temp_Humd_Sheet.SchDoc
size A4; SheetNumber: 6; SheetTotal: 7
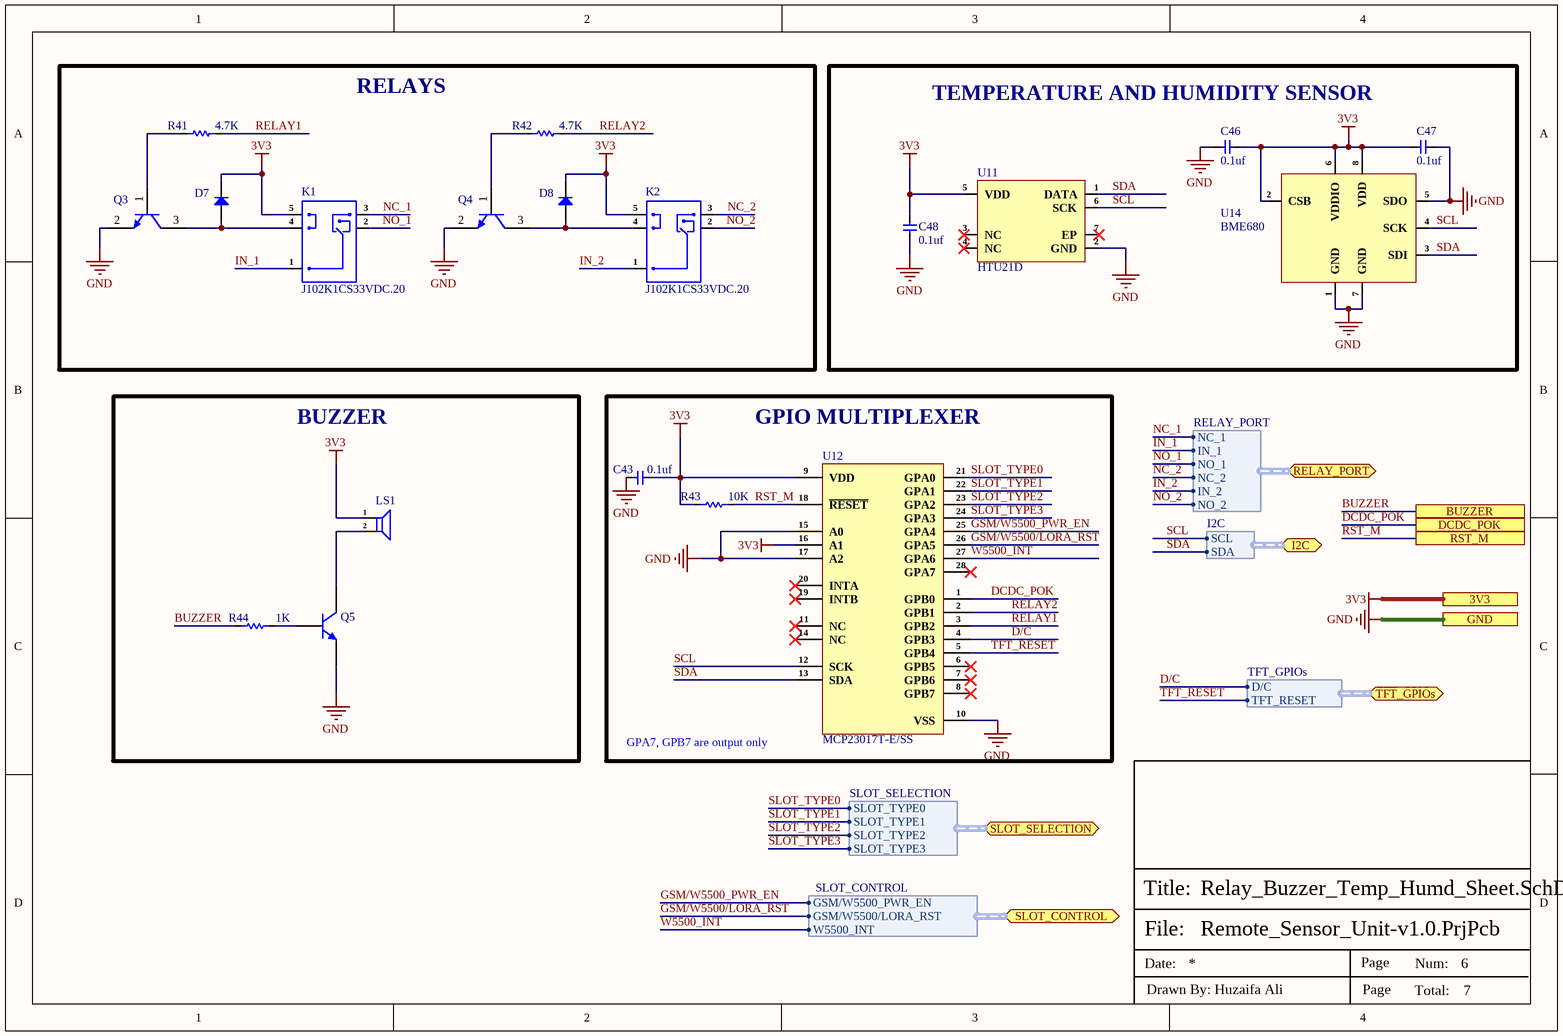
[diagram p5: Relay_Buzzer_Temp_Humd_Sheet.SchDoc]

### Parts
C43  0.1uf  [Cap-0402]
C46  0.1uf  [Cap-0402]
C47  0.1uf  [Cap-0402]
C48  0.1uf  [Cap-0402]
D7  1N4148WS-7-F  [SOD-323]  (value not drawn)
D8  1N4148WS-7-F  [SOD-323]  (value not drawn)
K1  J102K1CS33VDC.20  [J102K1CS33VDC.20]
K2  J102K1CS33VDC.20  [J102K1CS33VDC.20]
LS1  PKMCS0909E4000-R1  [PKMCS0909E4000-R1]  (value not drawn)
Q3  MMBT2222A-7-F  [SOT-23]  (value not drawn)
Q4  MMBT2222A-7-F  [SOT-23]  (value not drawn)
Q5  MMBT2222A-7-F  [SOT-23]  (value not drawn)
R41  4.7K  [Res-0402]
R42  4.7K  [Res-0402]
R43  10K  [Res-0201]
R44  1K  [Res-0201]
U11  HTU21D  [DFN-6-EP(3x3)]
U12  MCP23017T-E/SS  [SSOP-28-208mil]
U14  BME680  [BME680]

### Blocks framed on the sheet
RELAYS: D7 D8 K1 K2 Q3 Q4 R41 R42
TEMPERATURE AND HUMIDITY SENSOR: C46-C48 U11 U14
BUZZER: LS1 Q5 R44
GPIO MULTIPLEXER: C43 R43 U12

### Ports
3V3, BUZZER, DCDC_POK, GND, I2C (bidir, harness I2C), RELAY_PORT (bidir, harness RELAY_PORT), RST_M, SLOT_CONTROL (bidir, harness SLOT_CONTROL), SLOT_SELECTION (bidir, harness SLOT_SELECTION), TFT_GPIOs (bidir, harness TFT_GPIOs)

### Harnesses
RELAY_PORT: NC_2, NC_1, NO_2, NO_1, IN_2, IN_1
SLOT_SELECTION: SLOT_TYPE0, SLOT_TYPE1, SLOT_TYPE2, SLOT_TYPE3
SLOT_CONTROL: GSM/W5500_PWR_EN, GSM/W5500/LORA_RST, W5500_INT
I2C: SCL, SDA
TFT_GPIOs: D/C, TFT_RESET

### Nets
3V3: C43.1 C46.1 C47.2 C48.1 D7.1(K) D8.1(K) K1.5 K2.5 LS1.1(+) R43.2 U11.5(VDD) U12.9(VDD) U12.16(A1) U14.2(CSB) U14.6(VDDIO) U14.8(VDD) ; port 3V3
GND: C43.2 C46.2 C47.1 C48.2 Q3.2(E) Q4.2(E) Q5.2(E) U11.2(GND) U12.10(VSS) U12.15(A0) U12.17(A2) U14.1(GND) U14.5(SDO) U14.7(GND) ; port GND
BUZZER: R44.1 ; port BUZZER
D/C: U12.4(GPB3) ; port TFT_GPIOs.D/C
DCDC_POK: U12.1(GPB0) ; port DCDC_POK
GSM/W5500/LORA_RST: U12.26(GPA5) ; port SLOT_CONTROL.GSM/W5500/LORA_RST
GSM/W5500_PWR_EN: U12.25(GPA4) ; port SLOT_CONTROL.GSM/W5500_PWR_EN
IN_1: K1.1 ; port RELAY_PORT.IN_1
IN_2: K2.1 ; port RELAY_PORT.IN_2
NC_1: K1.3 ; port RELAY_PORT.NC_1
NC_2: K2.3 ; port RELAY_PORT.NC_2
NO_1: K1.2 ; port RELAY_PORT.NO_1
NO_2: K2.2 ; port RELAY_PORT.NO_2
RELAY1: R41.1 U12.3(GPB2)
RELAY2: R42.1 U12.2(GPB1)
RST_M: R43.1 U12.18(~{RESET}) ; port RST_M
SCL: U11.6(SCK) U12.12(SCK) U14.4(SCK) ; port I2C.SCL  [project net I2C.SCL]
SDA: U11.1(DATA) U12.13(SDA) U14.3(SDI) ; port I2C.SDA  [project net I2C.SDA]
SLOT_TYPE0: U12.21(GPA0) ; port SLOT_SELECTION.SLOT_TYPE0
SLOT_TYPE1: U12.22(GPA1) ; port SLOT_SELECTION.SLOT_TYPE1
SLOT_TYPE2: U12.23(GPA2) ; port SLOT_SELECTION.SLOT_TYPE2
SLOT_TYPE3: U12.24(GPA3) ; port SLOT_SELECTION.SLOT_TYPE3
TFT_RESET: U12.5(GPB4) ; port TFT_GPIOs.TFT_RESET
W5500_INT: U12.27(GPA6) ; port SLOT_CONTROL.W5500_INT
NetD7_2: D7.2(A) K1.4 Q3.3(C)
NetD8_2: D8.2(A) K2.4 Q4.3(C)
NetLS1_2: LS1.2(-) Q5.3(C)
NetQ3_1: Q3.1(B) R41.2
NetQ4_1: Q4.1(B) R42.2
NetQ5_1: Q5.1(B) R44.2

Not connected (* = marked no-connect by the designer): U11 3(NC)* 4(NC)* 7(EP)*; U12 6(GPB5)* 7(GPB6)* 8(GPB7)* 11(NC)* 14(NC)* 19(INTB)* 20(INTA)* 28(GPA7)*

### Notes on the sheet
- (near U12) GPA7, GPB7 are output only
- File:
- Title:
- Date:
- Page
- Num:
- Total:
- Drawn By: Huzaifa Ali

### Library data of the parts
C43 C46-C48 = GRM155R62A104KE14D: as C20 on sheet Power_Sheet2; Supplier 1: Arrow Electronics; Manufacturer Part Number: GRM155R62A104KE14D; RoHS: Yes; Category: Ceramic Capacitors; Stock 1: 870000; Pricing 1: 10000=0.00500, 20000=0.00410, 30000=0.00390, 50000=0.00370, 100000=0.00300 (USD); Mount: Surface Mount; Case/Package: 0402; Case Code (Metric): 1005; Case Code (Imperial): 0402; Weight: 0.000212oz; Min Operating Temperature: -55°C; Max Operating Temperature: 85°C; Packaging: Tape and Reel; Voltage Rating: 100V; Dielectric: X5R; Termination: SMD/SMT; Voltage Rating (DC): 100V; Package Quantity: 10000; Series: GRM; Length: 0.039inch; Width: 0.02inch; Height: 0.5mm; Thickness: 0.022inch; Reach SVHC Compliant: Yes; Lead Free: Lead Free; RoHS Compliant: Yes; ComponentLink1URL: http://www.farnell.com/datasheets/2079151.pdf?src-supplier=Farnell; ComponentLink1Description: http://www.farnell.com/datasheets/2079151.pdf?src-supplier=Farnell; ComponentLink2URL: http://www.mouser.com/ds/2/281/c02e-2905.pdf?src-supplier=Mouser; ComponentLink2Description: http://www.mouser.com/ds/2/281/c02e-2905.pdf?src-supplier=Mouser; ComponentLink3URL: http://www.farnell.com/datasheets/2079151.pdf?src-supplier=Element14; ComponentLink3Description: http://www.farnell.com/datasheets/2079151.pdf?src-supplier=Element14; ComponentLink4URL: http://search.murata.co.jp/Ceramy/image/img/A01X/G101/ENG/GRM155R62A104KE14-01.pdf?src-supplier=Digi-Key; ComponentLink4Description: http://search.murata.co.jp/Ceramy/image/img/A01X/G101/ENG/GRM155R62A104KE14-01.pdf?src-supplier=Digi-Key; ComponentLink5URL: http://www.farnell.com/datasheets/2079151.pdf?src-supplier=Newark; ComponentLink5Description: http://www.farnell.com/datasheets/2079151.pdf?src-supplier=Newark; Supplier Part Number 1: GRM155R62A104KE14D; LCSC Part Number: C162178
D7 D8 = 1N4148WS-7-F: DIODE GEN PURP 75V 150MA SOD323; Manufacturer: Diodes; Forward Current: 300mA; Reverse Recovery Time: 4ns; Element Configuration: Single; Forward Voltage: 1.25V; Max Reverse Current: 1uA; Peak Non-Repetitive Surge Current: 2A; Power Dissipation: 200mW; Polarity: Standard; Capacitance: 2pF; Supplier 1: Mouser; Manufacturer Part Number: 1N4148WS-7-F; RoHS: Yes; Category: Rectifier Diodes; Pricing 1: 1=0.19000, 10=0.17500, 50=0.17500, 100=0.09600, 500=0.05900, 1000=0.04000, 3000=0.03000, 9000=0.02600, 10000=0.02600, 24000=0.02300, 45000=0.01900 (USD); Mount: Surface Mount; Number of Pins: 2; Weight: 0.000173oz; Contact Plating: Tin,Matte; Min Operating Temperature: -65°C; Max Operating Temperature: 150°C; Max Repetitive Reverse Voltage (Vrrm): 75V; Max Forward Surge Current (Ifsm): 2A; Max Surge Current: 2A; Packaging: Tape and Reel; Recovery Time: 4ns; Package Quantity: 3000; Average Rectified Current: 150mA; Voltage Rating (DC): 75V; Power Rating: 200mW; Current Rating: 150mA; Output Current: 150mA; Voltage: 75V; Max Reverse Voltage (DC): 75V; Series: -; Reverse Recovery Time-Max: 4ns; Length: 1.8mm; Width: 1.4mm; Height: 1mm; Radiation Hardening: No; REACH SVHC: No SVHC; Lead Free: Lead Free; RoHS Compliant: Yes; ComponentLink1URL: https://datasheet.ciiva.com/1179/ds30097-1179355.pdf?src-supplier=Element14; ComponentLink1Description: https://datasheet.ciiva.com/1179/ds30097-1179355.pdf?src-supplier=Element14; ComponentLink2URL: https://datasheet.ciiva.com/8300/ds30097-8300396.pdf?src-supplier=Avnet; ComponentLink2Description: https://datasheet.ciiva.com/8300/ds30097-8300396.pdf?src-supplier=Avnet; ComponentLink3URL: https://datasheet.ciiva.com/16199/ds30097-16199061.pdf?src-supplier=Future+Electronics; ComponentLink3Description: https://datasheet.ciiva.com/16199/ds30097-16199061.pdf?src-supplier=Future+Electronics; ComponentLink4URL: https://datasheet.ciiva.com/911/ds30097-911742.pdf?src-supplier=Digi-Key; ComponentLink4Description: https://datasheet.ciiva.com/911/ds30097-911742.pdf?src-supplier=Digi-Key; ComponentLink5URL: https://datasheet.ciiva.com/911/ds30097-911743.pdf?src-supplier=Digi-Key; ComponentLink5Description: https://datasheet.ciiva.com/911/ds30097-911743.pdf?src-supplier=Digi-Key; ComponentLink6URL: https://datasheet.ciiva.com/911/ds30097-911741.pdf?src-supplier=Digi-Key; ComponentLink6Description: https://datasheet.ciiva.com/911/ds30097-911741.pdf?src-supplier=Digi-Key; Supplier Part Number 1: 621-1N4148WS-F; LCSC Part Number: C60580; Item Type: Diode
K1 K2 = J102K1CS33VDC.20: RELAY GEN PURPOSE SPDT 3A 3V; Manufacturer: CIT Relay & Switch; Supplier: Digi-Key; Supplier Part Number: 2449-J102K1CS33VDC.20-ND; Manufacturer Part Number: J102K1CS33VDC.20; RoHS: No; Category: Power Relays; Stock: 9880; Pricing: 1=1.6, 10=1.5, 25=1.3332, 50=1.2666, 100=1.1999, 250=1.06656, 500=0.9999, 1000=0.93324, 5000=0.89991 (USD); Item Type: Relay
LS1 = PKMCS0909E4000-R1: BUZZER PIEZO 1.5V 9X9MM SMD; Manufacturer: Murata; Supplier: Rs; Supplier Part Number: 9010898P; Manufacturer Part Number: PKMCS0909E4000-R1; RoHS: Yes; Category: Buzzers; Stock: 4400; Pricing: 50=0.646, 100=0.598, 250=0.55, 500=0.504 (GBP); ComponentLink1URL: https://datasheet.ciiva.com/24244/pkmcs0909e4000-r1-304946-24244386.pdf?src-supplier=Mouser; ComponentLink1Description: https://datasheet.ciiva.com/24244/pkmcs0909e4000-r1-304946-24244386.pdf?src-supplier=Mouser; Item Type: BUZZER
Q3-Q5 = MMBT2222A-7-F: TRANS NPN 40V 0.6A SMD SOT23-3; Manufacturer: Diodes; Max Power Dissipation: 300mW; Collector Base Voltage (VCBO): 75V; Max Collector Current: 600mA; hFE Min: 100; Frequency: 300MHz; Number of Elements: 1; Emitter Base Voltage (VEBO): 6V; Collector Emitter Saturation Voltage: 1V; Power Dissipation: 350mW; Element Configuration: Single; Current: 1A; Item Type: Mosfet; Supplier 1: Digi-Key; Manufacturer Part Number: MMBT2222A-7-F; Stock 1: 2471182; Pricing 1: 1=0.15, 10=0.134, 100=0.0729, 500=0.04486, 1000=0.03059 (USD); Mount: Surface Mount; Case/Package: SOT-23; Number of Pins: 3; Weight: 0.000282oz; Contact Plating: Matte,Tin; Min Operating Temperature: -55°C; Max Operating Temperature: 150°C; Packaging: Tape and Reel; Collector Emitter Voltage (VCEO): 40V; Polarity: NPN; Voltage Rating (DC): 40V; Package Quantity: 3000; Continuous Collector Current: 600mA; Collector Emitter Breakdown Voltage: 40V; Transition Frequency: 300MHz; Max Breakdown Voltage: 40V; Max Frequency: 300MHz; Termination: SMD/SMT; Gain Bandwidth Product: 300MHz; Current Rating: 600mA; Voltage: 40V; Length: 3.05mm; Height: 1mm; Width: 1.4mm; Radiation Hardening: No; Lead Free: Lead Free; REACH SVHC: No SVHC; ComponentLink1URL: http://www.diodes.com/datasheets/ds30041.pdf?src-supplier=Future+Electronics; ComponentLink1Description: http://www.diodes.com/datasheets/ds30041.pdf?src-supplier=Future+Electronics; ComponentLink2URL: http://www.diodes.com/datasheets/ds30041.pdf?src-supplier=Avnet; ComponentLink2Description: http://www.diodes.com/datasheets/ds30041.pdf?src-supplier=Avnet; ComponentLink3URL: https://www.verical.com/server-webapp/html/getDatasheet?partID=82692&src-supplier=Verical; ComponentLink3Description: https://www.verical.com/server-webapp/html/getDatasheet?partID=82692&src-supplier=Verical; ComponentLink4URL: https://www.diodes.com/assets/Datasheets/ds30041.pdf?src-supplier=Digi-Key; ComponentLink4Description: https://www.diodes.com/assets/Datasheets/ds30041.pdf?src-supplier=Digi-Key; ComponentLink5URL: http://www.diodes.com/datasheets/ds30041.pdf?src-supplier=Avnet+Europe; ComponentLink5Description: http://www.diodes.com/datasheets/ds30041.pdf?src-supplier=Avnet+Europe; ComponentLink6URL: http://www.diodes.com/datasheets/ds30041.pdf?src-supplier=Element14; ComponentLink6Description: http://www.diodes.com/datasheets/ds30041.pdf?src-supplier=Element14; Supplier Part Number 1: MMBT2222A-FDIDKR-ND; LCSC Part Number: C94515
R41 R42 = RC0402FR-074K7L: RES 4.7K OHM 1% 1/16W 0402; Manufacturer: Yageo; Voltage Rating (DC): 50V; Power Rating: 62.5mW; Resistance: 4.7kR; Temperature Coefficient: 100ppm/°C; Max Power Dissipation: 63mW; Item Type: Resistor; Supplier 1: Avnet; Manufacturer Part Number: RC0402FR-074K7L; RoHS: Yes; Category: Chip SMD Resistors; Stock 1: 2420000; Pricing 1: 10000=0.00085 (USD); Case/Package: 0402; Number of Pins: 2; Case Code (Imperial): 0402; Case Code (Metric): 1005; Size Code: 0402; Min Operating Temperature: -55°C; Max Operating Temperature: 155°C; Tolerance: 1%; Voltage Rating: 50V; Packaging: Tape and Reel; Resistor Type: Thick Film; Termination: SMD/SMT; Features: Moisture Resistant; Series: RC; Number of Terminations: 2; Resistance Tolerance: 1%; Construction: Rectangular; Length: 1mm; Width: 0.5mm; Height: 0.32mm; Depth: 0.5mm; Height - Seated (Max): 0.016inch; RoHS Compliant: Yes; Reach SVHC Compliant: Yes; Military Standard: Not; Lead Free: Lead Free; ComponentLink1URL: https://datasheet.ciiva.com/22661/1686128-22661342.pdf?src-supplier=Element14; ComponentLink1Description: https://datasheet.ciiva.com/22661/1686128-22661342.pdf?src-supplier=Element14; ComponentLink2URL: https://datasheet.ciiva.com/7850/1018594-7850022.pdf?src-supplier=Element14; ComponentLink2Description: https://datasheet.ciiva.com/7850/1018594-7850022.pdf?src-supplier=Element14; ComponentLink3URL: https://datasheet.ciiva.com/7850/1018594-7850023.pdf?src-supplier=Element14; ComponentLink3Description: https://datasheet.ciiva.com/7850/1018594-7850023.pdf?src-supplier=Element14; ComponentLink4URL: https://datasheet.ciiva.com/15215/getdatasheetpartid-328119-15215035.pdf?src-supplier=Verical; ComponentLink4Description: https://datasheet.ciiva.com/15215/getdatasheetpartid-328119-15215035.pdf?src-supplier=Verical; Supplier Part Number 1: RC0402FR-074K7L; LCSC Part Number: C105871
R43 = RC0201FR-0710KL: as R11 on sheet Power_Sheet2; Manufacturer Part Number: RC0201FR-0710KL; Package: 0201; ComponentLink7Description: LCSC; ComponentLink7URL: https://www.lcsc.com/product-detail/Chip-Resistor-Surface-Mount_YAGEO-RC0201FR-0710KL_C106225.html; LCSC Part Number: C106225
R44 = RC0201FR-071KP: RES 1K OHM 1% 1/20W 0201; Manufacturer: Yageo; Supplier 1: Digi-Key; Manufacturer Part Number: RC0201FR-071KP; RoHS: Yes; Stock 1: 4800; Pricing 1: 1=0.11000, 10=0.10200, 100=0.03940, 1000=0.01734, 2500=0.01497, 5000=0.01340 (USD); RoHS Compliant: Yes; Supplier Part Number 1: 13-RC0201FR-071KPCT-ND; LCSC Part Number: C3953443
U11 = HTU21D: DFN-6-EP(3x3) Temperature and Humidity Sensor ROHS; Manufacturer: TE Connectivity; Item Type: IC; Supplier: Mouser; Supplier Part Number: 824-HTU21D; Manufacturer Part Number: HTU21D; RoHS: Yes; Category: Temperature and Humidity Sensors; Stock: 15840; Pricing: 1=8.23, 10=5.36, 50=5.36, 100=4.48, 400=3.75, 800=3.5, 1000=3.5, 2400=3.38, 4800=3.26, 10000=3.21, 24800=3.14 (USD); ComponentLink1URL: http://www.farnell.com/datasheets/2207166.pdf?src-supplier=Farnell; ComponentLink1Description: http://www.farnell.com/datasheets/2207166.pdf?src-supplier=Farnell; ComponentLink2URL: https://datasheet.octopart.com/HTU21D-TE-Connectivity-datasheet-22149496.pdf?src-supplier=Farnell; ComponentLink2Description: https://datasheet.octopart.com/HTU21D-TE-Connectivity-datasheet-22149496.pdf?src-supplier=Farnell; ComponentLink3URL: https://datasheet.octopart.com/HTU21D-TE-Connectivity-datasheet-65793082.pdf?src-supplier=Element14; ComponentLink3Description: https://datasheet.octopart.com/HTU21D-TE-Connectivity-datasheet-65793082.pdf?src-supplier=Element14; ComponentLink4URL: https://datasheet.octopart.com/HTU21D-TE-Connectivity-datasheet-41524056.pdf?src-supplier=Newark; ComponentLink4Description: https://datasheet.octopart.com/HTU21D-TE-Connectivity-datasheet-41524056.pdf?src-supplier=Newark; LCSC Part Number: C83479
U12 = MCP23017T-E/SS: IC XPNDR 1.7MHZ I2C 28SSOP; Manufacturer: Microchip; Operating Supply Voltage: 5.5V; Interface: I2C,Serial; Number of Channels: 1; Output Current: 25mA; Number of I/Os: 16; Power Dissipation: 700mW; Clock Frequency: 10MHz; Output Type: PUSH-PULL; Supply Current: 1mA; Supplier 1: Digi-Key; Manufacturer Part Number: MCP23017T-E/SS; RoHS: Yes; Category: Interface ICs; Stock 1: 26314; Pricing 1: 1=1.69, 25=1.4, 100=1.28 (USD); Mounting Technology: Surface Mount; Case/Package: SSOP; Pins: 28; Min Operating Temperature: -40°C; Max Operating Temperature: 125°C; Package Quantity: 2100; Series: -; Packaging: Tape and Reel; Frequency: 1.7MHz; Number of Bits: 16; Nominal Supply Voltage: 5.5V; Lead Free: Lead Free; RoHS Compliant: Yes; ComponentLink1URL: https://datasheet.ciiva.com/12267/21952b-12267583.pdf?src-supplier=Mouser; ComponentLink1Description: https://datasheet.ciiva.com/12267/21952b-12267583.pdf?src-supplier=Mouser; ComponentLink2URL: https://datasheet.ciiva.com/8128/21952b-8128586.pdf?src-supplier=Avnet; ComponentLink2Description: https://datasheet.ciiva.com/8128/21952b-8128586.pdf?src-supplier=Avnet; ComponentLink3URL: https://datasheet.ciiva.com/16454/filehandler-aspxddocname-en023709-16454267.pdf?src-supplier=Future+Electronics; ComponentLink3Description: https://datasheet.ciiva.com/16454/filehandler-aspxddocname-en023709-16454267.pdf?src-supplier=Future+Electronics; ComponentLink4URL: https://datasheet.ciiva.com/1780/21952b-1780738.pdf?src-supplier=Digi-Key; ComponentLink4Description: https://datasheet.ciiva.com/1780/21952b-1780738.pdf?src-supplier=Digi-Key; Supplier Part Number 1: MCP23017T-E/SSCT-ND; LCSC Part Number: C558584; Item Type: IC
U14 = BME680: SENSOR RH PRESSURE TEMP VOC; Manufacturer: Bosch Sensortec; Sensor Type: Temperature; Output Type: SPI,I2C; Item Type: Temperature Sensor; Supplier 1: Future Electronics; Manufacturer Part Number: BME680; RoHS: No; Category: Uncategorized; Stock 1: 64; Pricing 1: 1=9.84000, 20=8.81000, 125=8.18000, 500=7.71000, 3000=7.09000 (USD); Min Operating Temperature: -40°C; Max Operating Temperature: 85°C; ComponentLink1URL: https://ae-bst.resource.bosch.com/media/_tech/media/application_notes/BST-BME680-HS000-05.pdf?src-supplier=Digi-Key; ComponentLink1Description: https://ae-bst.resource.bosch.com/media/_tech/media/application_notes/BST-BME680-HS000-05.pdf?src-supplier=Digi-Key; ComponentLink2URL: https://ae-bst.resource.bosch.com/media/_tech/media/product_flyer/BST-BME680-FL000.pdf?src-supplier=Digi-Key; ComponentLink2Description: https://ae-bst.resource.bosch.com/media/_tech/media/product_flyer/BST-BME680-FL000.pdf?src-supplier=Digi-Key; Supplier Part Number 1: 7107186; LCSC Part Number: C125972